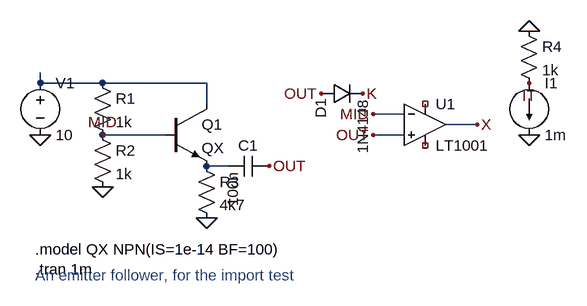
[diagram p0: schematic follower.asc]
follower.asc, the LTspice schematic file:
Version 4
SHEET 1 1200 680
WIRE -32 64 -32 48
WIRE 64 64 -32 64
WIRE 224 64 64 64
WIRE 224 96 224 64
WIRE 160 144 64 144
WIRE 256 192 224 192
WIRE 528 112 480 112
WIRE 528 144 480 144
WIRE 640 128 592 128
FLAG -32 144 0
FLAG 64 224 0
FLAG 64 144 MID
FLAG 224 272 0
FLAG 320 192 OUT
FLAG 400 80 OUT
FLAG 464 80 K
FLAG 480 112 MID
FLAG 480 144 OUT
FLAG 640 128 X
FLAG 720 144 0
FLAG 720 -16 0
FLAG 720 64 IT
SYMBOL voltage -32 48 R0
SYMATTR InstName V1
SYMATTR Value 10
SYMBOL res 48 48 R0
SYMATTR InstName R1
SYMATTR Value 1k
SYMBOL res 48 128 R0
SYMATTR InstName R2
SYMATTR Value 1k
SYMBOL npn 160 96 R0
SYMATTR InstName Q1
SYMATTR Value QX
SYMBOL res 208 176 R0
SYMATTR InstName R3
SYMATTR Value 4k7
SYMBOL cap 320 176 R90
WINDOW 0 0 32 VBottom 2
SYMATTR InstName C1
SYMATTR Value 100n
SYMBOL diode 400 64 M90
SYMATTR InstName D1
SYMATTR Value 1N4148
SYMBOL Opamps\LT1001 560 64 R0
SYMATTR InstName U1
SYMBOL current 720 64 R0
SYMATTR InstName I1
SYMATTR Value 1m
SYMBOL res 704 -32 R0
SYMATTR InstName R4
SYMATTR Value 1k
TEXT -40 320 Left 2 !.model QX NPN(IS=1e-14 BF=100)\n.tran 1m
TEXT -40 360 Left 2 ;An emitter follower, for the import test

The netlist it stands for:
* follower.asc
V1 N001 0 10
R1 N001 MID 1k
R2 MID 0 1k
Q1 N001 MID N002 0 QX
R3 N002 0 4k7
C1 OUT N002 100n
D1 OUT K 1N4148
XU1 OUT MID NC_01 NC_02 X LT1001  ; pins In+ In- V+ V- OUT
I1 IT 0 1m
R4 0 IT 1k
.model D D
.lib standard.dio
.model NPN NPN
.model PNP PNP
.lib standard.bjt
.model QX NPN(IS=1e-14 BF=100)
.tran 1m
* An emitter follower, for the import test
.lib LTC.lib
.backanno
.end